# Altium schematic sheet SFY_ADA_4G_00_CHG_POWER.SchDoc: SFY  CON / POWER / CHARGER
size 297 x 209 mm; SPICEModelCacheDBNBZIKH: <root> / <DocumentId>DBNBZIKH</DocumentId> / </root>; SheetNumber: 1; SheetTotal: 4
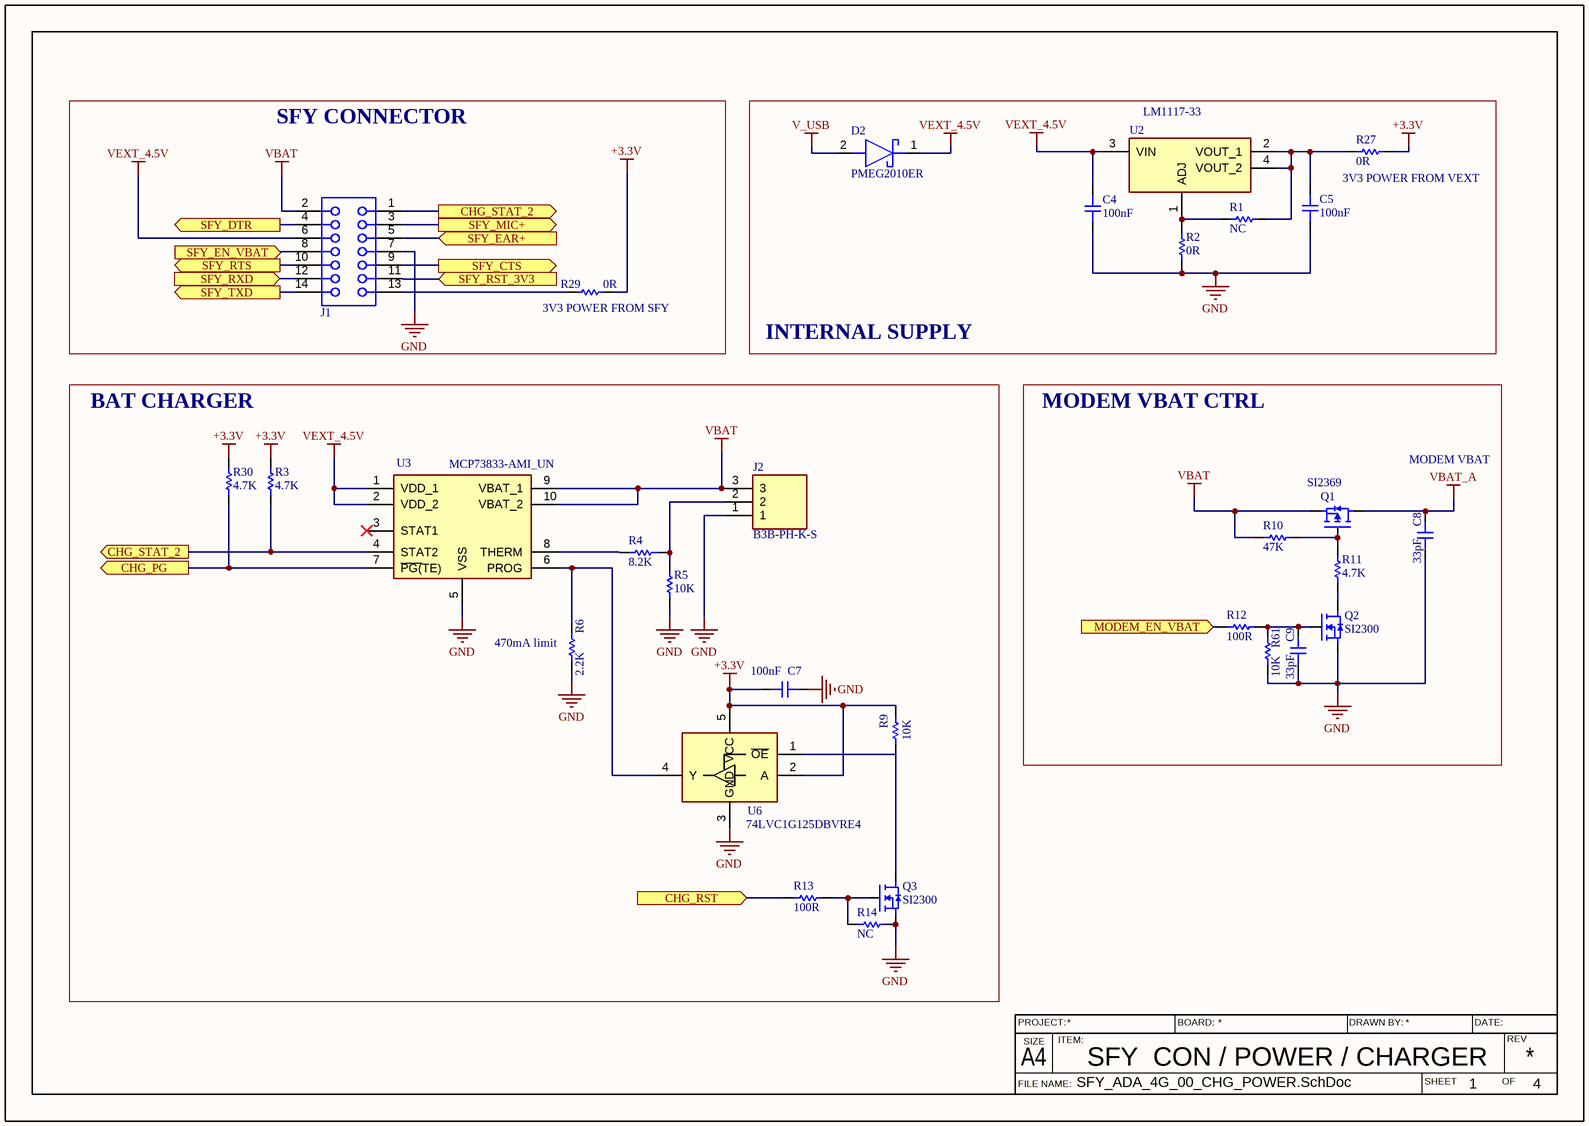
[diagram p0: SFY_ADA_4G_00_CHG_POWER.SchDoc]

## Parts
C4  100nF  [C_0603_H_0.8_M]
C5  100nF  [C_0603_H_0.8_M]
C7  100nF  [C_0603_H_0.8_M]
C8  33pF  [C_0603_H_0.8_M]
C9  33pF  [C_0603_H_0.8_M]
D2  PMEG2010ER  [SOD3716X135N]
J1  621014242921  [621014242921]  (value not drawn)
J2  B3B-PH-K-S  [B3BPHKS]
Q1  SI2369  [SOT23-3]
Q2  SI2300  [SOT23-3]
Q3  SI2300  [SOT23-3]
R1  NC  [R_0603_H_0.45_M]
R2  0R  [R_0603_H_0.45_M]
R3  4.7K  [R_0603_H_0.45_M]
R4  8.2K  [R_0603_H_0.45_M]
R5  10K  [R_0603_H_0.45_M]
R6  2.2K  [R_0603_H_0.45_M]
R9  10K  [R_0603_H_0.45_M]
R10  47K  [R_0603_H_0.45_M]
R11  4.7K  [R_0603_H_0.45_M]
R12  100R  [R_0603_H_0.45_M]
R13  100R  [R_0603_H_0.45_M]
R14  NC  [R_0603_H_0.45_M]
R27  0R  [R_0603_H_0.45_M]
R29  0R  [R_0603_H_0.45_M]
R30  4.7K  [R_0603_H_0.45_M]
R61  10K  [R_0603_H_0.45_M]
U2  LM1117-33  [SOT230P700X180-4N]
U3  MCP73833-AMI_UN  [SOP50P490X110-10N]
U6  74LVC1G125DBVRE4  [SOT95P280X145-5N]

## Blocks framed on the sheet
SFY CONNECTOR: J1 R29
INTERNAL SUPPLY: C4 C5 D2 R1 R2 R27 U2
BAT CHARGER: C7 J2 Q3 R3-R6 R9 R13 R14 R30 U3 U6
MODEM VBAT CTRL: C8 C9 Q1 Q2 R10-R12 R61

## Ports
CHG_PG (out, see SFY_ADA_4G_01_ESP[5B]), CHG_RST (in, see SFY_ADA_4G_01_ESP[5B]), CHG_STAT_2 (out, see SFY_ADA_4G_00_CHG_POWER[1B]), CHG_STAT_2 (out, see SFY_ADA_4G_00_CHG_POWER[2A]), MODEM_EN_VBAT (in, see SFY_ADA_4G_01_ESP[5C]), SFY_CTS (out, see SFY_ADA_4G_01_ESP[3B]), SFY_DTR (out, see SFY_ADA_4G_01_ESP[3B]), SFY_EAR+ (in, see SFY_ADA_4G_02_MODEM_1[6A]), SFY_EN_VBAT (in, see SFY_ADA_4G_01_ESP[3B]), SFY_MIC+ (out, see SFY_ADA_4G_02_MODEM_1[6B]), SFY_RST_3V3 (in, see SFY_ADA_4G_01_ESP[3B]), SFY_RTS (out, see SFY_ADA_4G_01_ESP[3B]), SFY_RXD (in, see SFY_ADA_4G_01_ESP[3B]), SFY_TXD (out, see SFY_ADA_4G_01_ESP[3B])

## Nets
+3.3V: C7.1 R3.2 R9.1 R27.1 R29.1 R30.2 U6.2(A) U6.5(VCC)
GND: C4.1 C5.1 C7.2 C8.2 C9.2 J1.7 J2.1 Q2.2(S) Q3.2(S) R2.1 R5.1 R6.2 R14.2 R61.2 U3.5(VSS) U6.3(GND)
V_USB: D2.2(A)
VBAT: J1.2 J2.3 Q1.2(S) R10.2 U3.9(VBAT_1) U3.10(VBAT_2)
VBAT_A: C8.1 Q1.3(D)
VEXT_4.5V: C4.2 D2.1(K) J1.6 U2.3(VIN) U3.1(VDD_1) U3.2(VDD_2)
CHG_PG: R30.1 U3.7(~{PG(}TE)) ; port CHG_PG
CHG_RST: R13.1 ; port CHG_RST
CHG_STAT_2: J1.1 R3.1 U3.4(STAT2) ; port CHG_STAT_2
MODEM_EN_VBAT: R12.2 ; port MODEM_EN_VBAT
SFY_CTS: J1.9 ; port SFY_CTS
SFY_DTR: J1.4 ; port SFY_DTR
SFY_EAR+: J1.5 ; port SFY_EAR+
SFY_EN_VBAT: J1.8 ; port SFY_EN_VBAT
SFY_MIC+: J1.3 ; port SFY_MIC+
SFY_RST_3V3: J1.11 ; port SFY_RST_3V3
SFY_RTS: J1.10 ; port SFY_RTS
SFY_RXD: J1.12 ; port SFY_RXD
SFY_TXD: J1.14 ; port SFY_TXD
NetC5_2: C5.2 R1.2 R27.2 U2.2(VOUT_1) U2.4(VOUT_2)
NetC9_1: C9.1 Q2.1(G) R12.1 R61.1
NetJ1_13: J1.13 R29.2
NetJ2_2: J2.2 R4.2 R5.2
NetQ1_1: Q1.1(G) R10.1 R11.1
NetQ2_3: Q2.3(D) R11.2
NetQ3_1: Q3.1(G) R13.2 R14.1
NetQ3_3: Q3.3(D) R9.2 U6.1(~{OE})
NetR1_1: R1.1 R2.2 U2.1(ADJ)
NetR4_1: R4.1 U3.8(THERM)
NetR6_1: R6.1 U3.6(PROG) U6.4(Y)

Not connected (* = marked no-connect by the designer): U3 3(STAT1)*

## Notes on the sheet
- 3V3 POWER FROM VEXT
- (near R29) 3V3 POWER FROM SFY
- MODEM VBAT
- (near R6) 470mA limit
- FILE NAME:
- PROJECT:
- A4
- SIZE
- ITEM:
- BOARD:
- DRAWN BY:
- SHEET
- DATE:
- OF
- REV

## Library data of the parts
C4 C5 C7 = C: X7R 10% 10V; Symbol_Valid: 20260706; Manufacturer_Name: *; Manufacturer_Ref: *; Keolabs_ref: *
C8 C9 = C: NP0 10% 10V; Symbol_Valid: 20260706; Manufacturer_Name: *; Manufacturer_Ref: *; Keolabs_ref: *
D2 = BAT54W-HG3-08: Schottky Diode; Manufacturer_Name: Vishay; Datasheet Link: https://componentsearchengine.com/Datasheets/1/BAT54W-HG3-08.pdf; Height: 1.35mm; Manufacturer_Part_Number: BAT54W-HG3-08; Mouser Part Number: 78-BAT54W-HG3-08; Mouser Price/Stock: https://www.mouser.co.uk/ProductDetail/Vishay-Semiconductors/BAT54W-HG3-08?qs=BJlw7L4Cy79Yn3Vxayemjg%3D%3D; Arrow Part Number: BAT54W-HG3-08; Arrow Price/Stock: https://www.arrow.com/en/products/bat54w-hg3-08/vishay?region=nac
J1 = 621014242921: WR-PHD Socket Header, SMT, Vertical, pitch 2mm, 2 Row, 14P; Manufacturer: Wurth Elektronik; Contact Resistance: 20mΩ; Rated Current: 2A; Working Voltage: 250V; Withstanding Voltage: 500V; ComponentLink1Description: Website Link; ComponentLink1URL: https://www.we-online.com/redexpert/article/621014242921?ad; ComponentLink2Description: Datasheet Link; ComponentLink2URL: https://www.we-online.com/redexpert/spec/621014242921?ad; Manufacturer Part Number: 621014242921; Category: Board-to-Board Connectors; Match Code: WR-PHD; Mount: Surface Mount; Operating Temperature Max: 105°C; Operating Temperature Min: -40°C; Packaging: Tube; Gender: Socket Header; Number of Pins: 14; Number of Rows: 2; Orientation: Vertical; Pitch: 2mm
J2 = B3B-PH-K-S: Connector; Manufacturer_Name: JST (JAPAN SOLDERLESS TERMINALS); Datasheet Link: https://www.jst-mfg.com/product/pdf/eng/ePH.pdf; Height: 6mm; Manufacturer_Part_Number: B3B-PH-K-S
Q1 = T_MOS_D_P: 3.1A 30V 0.68OHM SOT-23; Symbol_Valid: 20260706; Manufacturer_Name: *; Manufacturer_Ref: *; Keolabs_Ref: *
Q2 Q3 = T_MOS_D_N: 3.6A 30V 0,68OHM  SOT-23; Symbol_Valid: 20260706; Manufacturer_Name: *; Manufacturer_Ref: *; Keolabs_Ref: *
R1-R6 R9-R14 R27 R29 R30 R61 = R: 1% 0603; Symbol_Valid: 20260706; Manufacturer_Name: *; Manufacturer_Ref: *; Keolabs_Ref: *
U2 = LM317EMP_NOPB: Integrated Circuit; Manufacturer_Name: Texas Instruments; Manufacturer_Part_Number: LM317EMP/NOPB; Datasheet Link: https://datasheet.datasheetarchive.com/originals/distributors/Datasheets-SFU2/DSASFU100037177.pdf; Height: 1.8mm; Mouser Part Number: 926-LM317EMP/NOPB; Mouser Price/Stock: https://www.mouser.co.uk/ProductDetail/Texas-Instruments/LM317EMP-NOPB?qs=X1J7HmVL2ZHVCQuTuwGwvw%3D%3D; Arrow Part Number: LM317EMP/NOPB; Arrow Price/Stock: https://www.arrow.com/en/products/lm317empnopb/texas-instruments
U3 = MCP73833-AMI_UN: Integrated Circuit; Manufacturer_Name: Microchip; Manufacturer_Part_Number: MCP73833-AMI/UN; Datasheet Link: http://componentsearchengine.com/Datasheets/1/MCP73833-AMI_UN.pdf; Height: 1.1mm; Mouser Part Number: 579-MCP73833-AMI/UN; Mouser Price/Stock: https://www.mouser.co.uk/ProductDetail/Microchip-Technology/MCP73833-AMI-UN?qs=Fxu3fLyJv8fd%2FGnsUSC9lg%3D%3D; Arrow Part Number: MCP73833-AMI/UN; Arrow Price/Stock: https://www.arrow.com/en/products/mcp73833-amiun_2/microchip-technology.html?utm_currency=USD&region=nac
U6 = 74LVC1G125DBVRE4: Integrated Circuit; Manufacturer_Name: Texas Instruments; Datasheet Link: https://www.ti.com/lit/ds/symlink/sn74lvc1g125.pdf?ts=1638417397474&ref_url=https%253A%252F%252Fwww.google.com%252F; Height: 1.45mm; Manufacturer_Part_Number: 74LVC1G125DBVRE4; Mouser Part Number: 595-74LVC1G125DBVRE4; Mouser Price/Stock: https://www.mouser.co.uk/ProductDetail/Texas-Instruments/74LVC1G125DBVRE4?qs=pajgIaoyDUg%2FeHLuOYECCA%3D%3D; Arrow Part Number: 74LVC1G125DBVRE4; Arrow Price/Stock: https://www.arrow.com/en/products/74lvc1g125dbvre4/texas-instruments?utm_currency=USD&region=nac